# Altium schematic sheet 16_ETH_Magjack.SchDoc
size A3; SheetNumber: 6; SheetTotal: 20
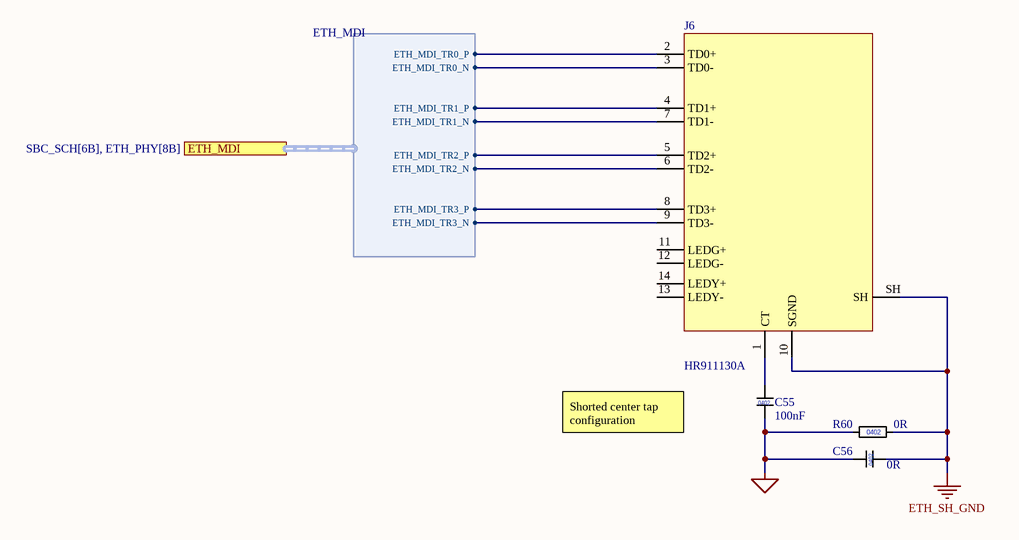
[diagram p0: 16_ETH_Magjack.SchDoc]

## Parts
C55  value 100nF  [C0402]  (hidden comment: C_0402)
C56  value 0R  [C0402]  (hidden comment: C_0402)
J6  HR911130A  [HR911130A]
R60  value 0R  [R0402]  (hidden comment: 0402)

## Ports
ETH_MDI (harness ETH_MDI, see SBC_SCH[6B], ETH_PHY[8B])

## Harnesses
ETH_MDI: ETH_MDI_TR0_P, ETH_MDI_TR0_N, ETH_MDI_TR1_P, ETH_MDI_TR1_N, ETH_MDI_TR2_P, ETH_MDI_TR2_N, ETH_MDI_TR3_P, ETH_MDI_TR3_N

## Nets
ETH_SH_GND: C56.2 J6.10(SGND) J6.SH R60.R?
GND: C55.2 C56.1 R60.1
NetC55_1: C55.1 J6.1(CT)
NetJ6_2: J6.2(TD0+) ; port ETH_MDI.ETH_MDI_TR0_P
NetJ6_3: J6.3(TD0-) ; port ETH_MDI.ETH_MDI_TR0_N
NetJ6_4: J6.4(TD1+) ; port ETH_MDI.ETH_MDI_TR1_P
NetJ6_5: J6.5(TD2+) ; port ETH_MDI.ETH_MDI_TR2_P
NetJ6_6: J6.6(TD2-) ; port ETH_MDI.ETH_MDI_TR2_N
NetJ6_7: J6.7(TD1-) ; port ETH_MDI.ETH_MDI_TR1_N
NetJ6_8: J6.8(TD3+) ; port ETH_MDI.ETH_MDI_TR3_P
NetJ6_9: J6.9(TD3-) ; port ETH_MDI.ETH_MDI_TR3_N

Not connected (* = marked no-connect by the designer): J6 11(LEDG+) 12(LEDG-) 13(LEDY-) 14(LEDY+)

## Notes on the sheet
- Shorted center tap configuration
- (in symbol C_0402) 0402

## Library data of the parts
C55 C56 = C_0402: MLCC 0402; Manufacturer_Name: *; Manufacturer_Part_Number: *
J6 = HR911130A: 1 port RJ45 MagJack GIGABIT Right Angle Shielded With Contact Spring With LED; Manufacturer_Name: HANRUN(Zhongshan HanRun Elec); Manufacturer_Part_Number: HR915350C; Height: 13.55
R60 = R_0402: Tolerance: 1%; Manufacturer_Name: *; Manufacturer_Part_Number: *